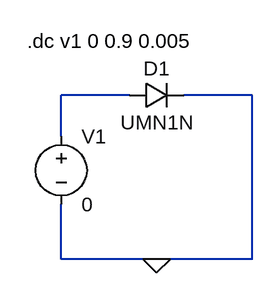
[diagram p0: schematic schema1.asc]
schema1.asc, the LTspice schematic file:
Version 4.1
SHEET 1 880 680
WIRE 192 80 112 80
WIRE 336 80 256 80
WIRE 112 128 112 80
WIRE 112 272 112 208
WIRE 224 272 112 272
WIRE 336 272 336 80
WIRE 336 272 224 272
FLAG 224 272 0
SYMBOL diode 192 96 R270
WINDOW 0 32 32 VTop 2
WINDOW 3 0 32 VBottom 2
SYMATTR InstName D1
SYMATTR Value UMN1N
SYMBOL voltage 112 112 R0
WINDOW 123 0 0 Left 0
WINDOW 39 0 0 Left 0
SYMATTR InstName V1
SYMATTR Value 0
TEXT 72 16 Left 2 !.dc v1 0 0.9 0.005

The netlist it stands for:
* schema1.asc
D1 N001 0 UMN1N
V1 N001 0 0
.model D D
.lib standard.dio
.dc v1 0 0.9 0.005
.backanno
.end